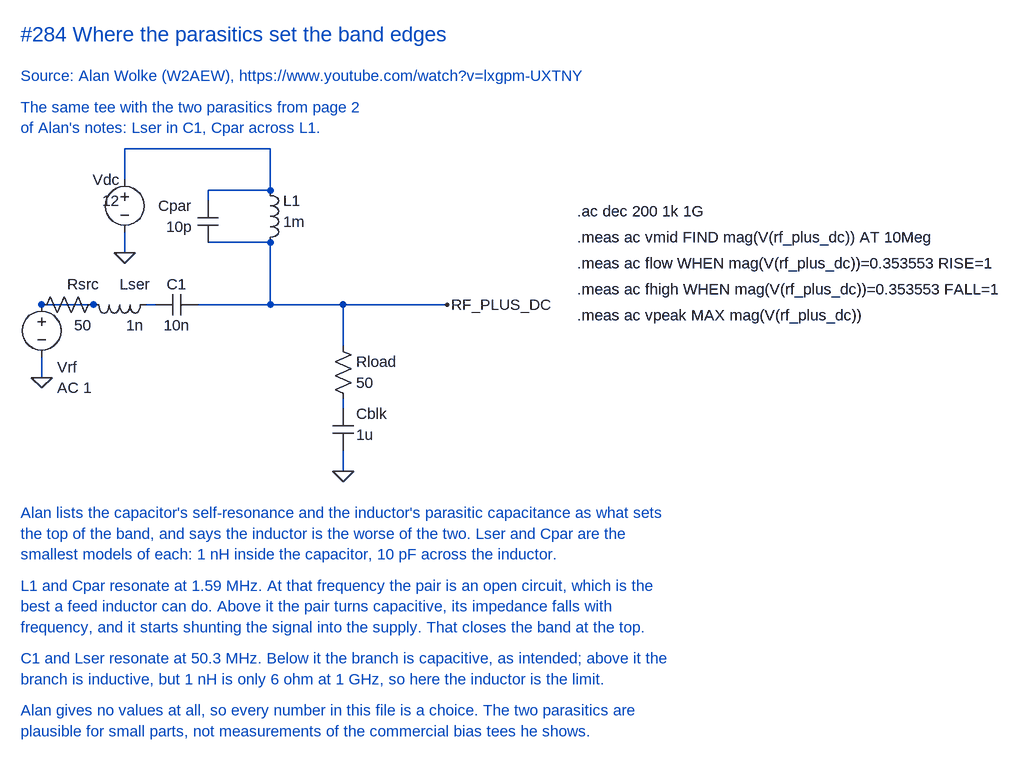
[diagram p0: schematic Bias tee with parasitics.asc]
Bias tee with parasitics.asc, the LTspice schematic file:
Version 4
SHEET 1 1300 800
WIRE 176 304 256 304
WIRE 176 384 176 416
WIRE 304 112 304 64
WIRE 304 64 528 64
WIRE 528 64 528 128
WIRE 528 208 528 304
WIRE 528 128 432 128
WIRE 432 128 432 144
WIRE 432 208 528 208
WIRE 304 192 304 224
WIRE 336 304 352 304
WIRE 416 304 800 304
WIRE 640 304 640 352
WIRE 640 352 640 368
WIRE 640 448 640 464
WIRE 640 528 640 560
FLAG 176 416 0
FLAG 304 224 0
FLAG 640 560 0
FLAG 800 304 RF_PLUS_DC
SYMBOL voltage 176 288 R0
WINDOW 0 24 112 Left 2
WINDOW 3 24 144 Left 2
SYMATTR InstName Vrf
SYMATTR Value AC 1
SYMBOL res 272 288 R90
WINDOW 0 0 32 VBottom 2
WINDOW 3 32 32 VTop 2
SYMATTR InstName Rsrc
SYMATTR Value 50
SYMBOL ind 352 288 R90
WINDOW 0 0 32 VBottom 2
WINDOW 3 32 32 VTop 2
SYMATTR InstName Lser
SYMATTR Value 1n
SYMBOL cap 416 288 R90
WINDOW 0 0 32 VBottom 2
WINDOW 3 32 32 VTop 2
SYMATTR InstName C1
SYMATTR Value 10n
SYMBOL ind 512 112 R0
WINDOW 0 36 32 Left 2
WINDOW 3 36 64 Left 2
SYMATTR InstName L1
SYMATTR Value 1m
SYMBOL cap 416 144 R0
WINDOW 0 -8 8 Right 2
WINDOW 3 -8 40 Right 2
SYMATTR InstName Cpar
SYMATTR Value 10p
SYMBOL voltage 304 96 R0
WINDOW 0 -8 16 Right 2
WINDOW 3 -8 48 Right 2
SYMATTR InstName Vdc
SYMATTR Value 12
SYMBOL res 624 352 R0
WINDOW 0 36 40 Left 2
WINDOW 3 36 72 Left 2
SYMATTR InstName Rload
SYMATTR Value 50
SYMBOL cap 624 464 R0
WINDOW 0 36 8 Left 2
WINDOW 3 36 40 Left 2
SYMATTR InstName Cblk
SYMATTR Value 1u
TEXT 144 -112 Left 3 ;#284 Where the parasitics set the band edges
TEXT 144 -48 Left 2 ;Source: Alan Wolke (W2AEW), https://www.youtube.com/watch?v=lxgpm-UXTNY
TEXT 144 0 Left 2 ;The same tee with the two parasitics from page 2
TEXT 144 32 Left 2 ;of Alan's notes: Lser in C1, Cpar across L1.
TEXT 144 624 Left 2 ;Alan lists the capacitor's self-resonance and the inductor's parasitic capacitance as what sets
TEXT 144 656 Left 2 ;the top of the band, and says the inductor is the worse of the two. Lser and Cpar are the
TEXT 144 688 Left 2 ;smallest models of each: 1 nH inside the capacitor, 10 pF across the inductor.
TEXT 144 736 Left 2 ;L1 and Cpar resonate at 1.59 MHz. At that frequency the pair is an open circuit, which is the
TEXT 144 768 Left 2 ;best a feed inductor can do. Above it the pair turns capacitive, its impedance falls with
TEXT 144 800 Left 2 ;frequency, and it starts shunting the signal into the supply. That closes the band at the top.
TEXT 144 848 Left 2 ;C1 and Lser resonate at 50.3 MHz. Below it the branch is capacitive, as intended; above it the
TEXT 144 880 Left 2 ;branch is inductive, but 1 nH is only 6 ohm at 1 GHz, so here the inductor is the limit.
TEXT 144 928 Left 2 ;Alan gives no values at all, so every number in this file is a choice. The two parasitics are
TEXT 144 960 Left 2 ;plausible for small parts, not measurements of the commercial bias tees he shows.
TEXT 1000 160 Left 2 !.ac dec 200 1k 1G
TEXT 1000 200 Left 2 !.meas ac vmid FIND mag(V(rf_plus_dc)) AT 10Meg
TEXT 1000 240 Left 2 !.meas ac flow WHEN mag(V(rf_plus_dc))=0.353553 RISE=1
TEXT 1000 280 Left 2 !.meas ac fhigh WHEN mag(V(rf_plus_dc))=0.353553 FALL=1
TEXT 1000 320 Left 2 !.meas ac vpeak MAX mag(V(rf_plus_dc))

The netlist it stands for:
* Bias tee with parasitics.asc
Vrf N001 0 AC 1
Rsrc N001 N001 50
Lser N003 N001 1n
C1 RF_PLUS_DC N003 10n
L1 N002 RF_PLUS_DC 1m
Cpar N002 RF_PLUS_DC 10p
Vdc N002 0 12
Rload RF_PLUS_DC N004 50
Cblk N004 0 1u
* #284 Where the parasitics set the band edges
* Source: Alan Wolke (W2AEW), https://www.youtube.com/watch?v=lxgpm-UXTNY
* The same tee with the two parasitics from page 2
* of Alan's notes: Lser in C1, Cpar across L1.
* Alan lists the capacitor's self-resonance and the inductor's parasitic capacitance as what sets
* the top of the band, and says the inductor is the worse of the two. Lser and Cpar are the
* smallest models of each: 1 nH inside the capacitor, 10 pF across the inductor.
* L1 and Cpar resonate at 1.59 MHz. At that frequency the pair is an open circuit, which is the
* best a feed inductor can do. Above it the pair turns capacitive, its impedance falls with
* frequency, and it starts shunting the signal into the supply. That closes the band at the top.
* C1 and Lser resonate at 50.3 MHz. Below it the branch is capacitive, as intended; above it the
* branch is inductive, but 1 nH is only 6 ohm at 1 GHz, so here the inductor is the limit.
* Alan gives no values at all, so every number in this file is a choice. The two parasitics are
* plausible for small parts, not measurements of the commercial bias tees he shows.
.ac dec 200 1k 1G
.meas ac vmid FIND mag(V(rf_plus_dc)) AT 10Meg
.meas ac flow WHEN mag(V(rf_plus_dc))=0.353553 RISE=1
.meas ac fhigh WHEN mag(V(rf_plus_dc))=0.353553 FALL=1
.meas ac vpeak MAX mag(V(rf_plus_dc))
.backanno
.end